# Altium schematic sheet 3G Modem_Section.SchDoc
size A4; DocumentNumber: 5; SheetNumber: 5; SheetTotal: 7
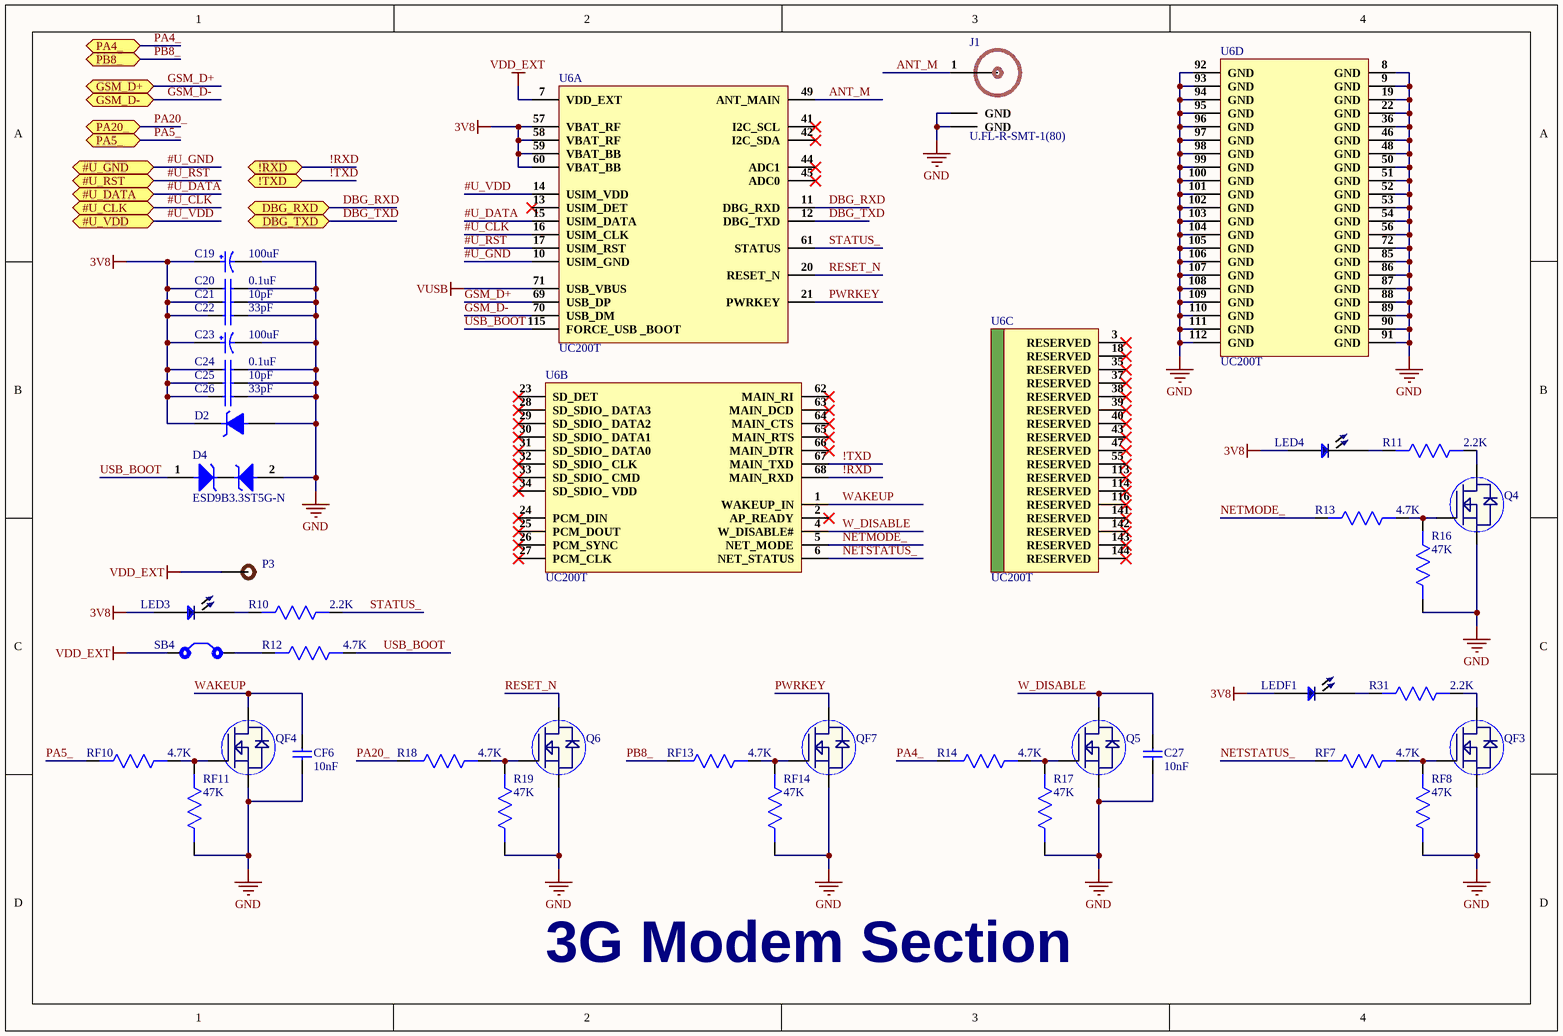
[diagram p0: 3G Modem_Section.SchDoc]

## Parts
C19  100uF  [16TQC100MYF]
C20  0.1uF  [Cap0402]
C21  10pF  [Cap0402]
C22  33pF  [Cap0402]
C23  100uF  [16TQC100MYF]
C24  0.1uF  [Cap0402]
C25  10pF  [Cap0402]
C26  33pF  [Cap0402]
C27  10nF  [Cap0402]
CF6  10nF  [Cap0402]
D2  BZD27C5V1P_R1_00001  [BZD27C5V1P_R1_00001]  (value not drawn)
D4  ESD9B3.3ST5G-N  [ESD9B3.3ST5G-N]
J1  U.FL-R-SMT-1(80)  [U.FL-R-SMT-1(80)]
LED3  TJ-S1005SW4TGLC6B-A5  [LED 0402]  (value not drawn)
LED4  TJ-S1005SW4TGLC7K-A5  [LED 0402]  (value not drawn)
LEDF1  TJ-S1005SW4TGLC7K-A5  [LED 0402]  (value not drawn)
P3  Test Point  [TEST POINT]  (value not drawn)
Q4  BSS138LT1G  [SOT23-3]  (value not drawn)
Q5  BSS138LT1G  [SOT23-3]  (value not drawn)
Q6  BSS138LT1G  [SOT23-3]  (value not drawn)
QF3  BSS138LT1G  [SOT23-3]  (value not drawn)
QF4  BSS138LT1G  [SOT23-3]  (value not drawn)
QF7  BSS138LT1G  [SOT23-3]  (value not drawn)
R10  2.2K  [Res0402]
R11  2.2K  [Res0402]
R12  4.7K  [Res0402]
R13  4.7K  [Res0402]
R14  4.7K  [Res0402]
R16  47K  [Res0402]
R17  47K  [Res0402]
R18  4.7K  [Res0402]
R19  47K  [Res0402]
R31  2.2K  [Res0402]
RF7  4.7K  [Res0402]
RF8  47K  [Res0402]
RF10  4.7K  [Res0402]
RF11  47K  [Res0402]
RF13  4.7K  [Res0402]
RF14  47K  [Res0402]
SB4  Solder Bridge  [Solder Bridge]  (value not drawn)
U6  UC200T  [UC200T]  (parts A,B,C,D of 4)

## Ports
!RXD (bidir), !TXD (bidir), #U_CLK (bidir), #U_DATA (bidir), #U_GND (bidir), #U_RST (bidir), #U_VDD (bidir), DBG_RXD (bidir), DBG_TXD (bidir), GSM_D+ (bidir), GSM_D- (bidir), PA4_ (bidir), PA5_ (bidir), PA20_ (bidir), PB8_ (bidir)

## Nets
3V8: C19.1 C20.1 C21.1 C22.1 C23.1 C24.1 C25.1 C26.1 D2.2(CATHODE) LED3.1 LED4.1 LEDF1.1 U6.57(VBAT_RF) U6.58(VBAT_RF) U6.59(VBAT_BB) U6.60(VBAT_BB)
GND: C19.2 C20.2 C21.2 C22.2 C23.2 C24.2 C25.2 C26.2 C27.1 CF6.1 D2.1(ANODE) D4.2 J1.2(GND) J1.3(GND) Q4.2(S) Q5.2(S) Q6.2(S) QF3.2(S) QF4.2(S) QF7.2(S) R16.2 R17.2 R19.2 RF8.2 RF11.2 RF14.2 U6.8(GND) U6.9(GND) U6.19(GND) U6.22(GND) U6.36(GND) U6.46(GND) U6.48(GND) U6.50(GND) U6.51(GND) U6.52(GND) U6.53(GND) U6.54(GND) U6.56(GND) U6.72(GND) U6.85(GND) U6.86(GND) U6.87(GND) U6.88(GND) U6.89(GND) U6.90(GND) U6.91(GND) U6.92(GND) U6.93(GND) U6.94(GND) U6.95(GND) U6.96(GND) U6.97(GND) U6.98(GND) U6.99(GND) U6.100(GND) U6.101(GND) U6.102(GND) U6.103(GND) U6.104(GND) U6.105(GND) U6.106(GND) U6.107(GND) U6.108(GND) U6.109(GND) U6.110(GND) U6.111(GND) U6.112(GND)
VDD_EXT: P3.1 SB4.1 U6.7(VDD_EXT)
VUSB: U6.71(USB_VBUS)
!RXD: U6.68(MAIN_RXD) ; port !RXD
!TXD: U6.67(MAIN_TXD) ; port !TXD
#U_CLK: U6.16(USIM_CLK) ; port #U_CLK
#U_DATA: U6.15(USIM_DATA) ; port #U_DATA
#U_GND: U6.10(USIM_GND) ; port #U_GND
#U_RST: U6.17(USIM_RST) ; port #U_RST
#U_VDD: U6.14(USIM_VDD) ; port #U_VDD
ANT_M: J1.1(RF_IN) U6.49(ANT_MAIN)
DBG_RXD: U6.11(DBG_RXD) ; port DBG_RXD
DBG_TXD: U6.12(DBG_TXD) ; port DBG_TXD
GSM_D+: U6.69(USB_DP) ; port GSM_D+
GSM_D-: U6.70(USB_DM) ; port GSM_D-
NETMODE_: R13.2 U6.5(NET_MODE)
NETSTATUS_: RF7.2 U6.6(NET_STATUS)
PA4_: R14.2 ; port PA4_
PA5_: RF10.2 ; port PA5_
PA20_: R18.2 ; port PA20_
PB8_: RF13.2 ; port PB8_
PWRKEY: QF7.3(D) U6.21(PWRKEY)
RESET_N: Q6.3(D) U6.20(RESET_N)
STATUS_: R10.1 U6.61(STATUS)
USB_BOOT: D4.1 R12.1 U6.115(FORCE_USB__BOOT)
W_DISABLE: C27.2 Q5.3(D) U6.4(W_DISABLE#)
WAKEUP: CF6.2 QF4.3(D) U6.1(WAKEUP_IN)
NetLED3_2: LED3.2 R10.2
NetLED4_2: LED4.2 R11.2
NetLEDF1_2: LEDF1.2 R31.2
NetQ4_1: Q4.1(G) R13.1 R16.1
NetQ4_3: Q4.3(D) R11.1
NetQ5_1: Q5.1(G) R14.1 R17.1
NetQ6_1: Q6.1(G) R18.1 R19.1
NetQF3_1: QF3.1(G) RF7.1 RF8.1
NetQF3_3: QF3.3(D) R31.1
NetQF4_1: QF4.1(G) RF10.1 RF11.1
NetQF7_1: QF7.1(G) RF13.1 RF14.1
NetR12_2: R12.2 SB4.2

Not connected (* = marked no-connect by the designer): U6 2(AP_READY)* 3(RESERVED)* 13(USIM_DET)* 18(RESERVED)* 23(SD_DET)* 24(PCM_DIN)* 25(PCM_DOUT)* 26(PCM_SYNC)* 27(PCM_CLK)* 28(SD_SDIO__DATA3)* 29(SD_SDIO__DATA2)* 30(SD_SDIO__DATA1)* 31(SD_SDIO__DATA0)* 32(SD_SDIO__CLK)* 33(SD_SDIO__CMD)* 34(SD_SDIO__VDD)* 35(RESERVED)* 37(RESERVED)* 38(RESERVED)* 39(RESERVED)* 40(RESERVED)* 41(I2C_SCL)* 42(I2C_SDA)* 43(RESERVED)* 44(ADC1)* 45(ADC0)* 47(RESERVED)* 55(RESERVED)* 62(MAIN_RI)* 63(MAIN_DCD)* 64(MAIN_CTS)* 65(MAIN_RTS)* 66(MAIN_DTR)* 113(RESERVED)* 114(RESERVED)* 116(RESERVED)* 141(RESERVED)* 142(RESERVED)* 143(RESERVED)* 144(RESERVED)*

## Notes on the sheet
- 3G Modem Section

## Library data of the parts
C19 C23 = 16TQC100MYF: CAP TANT POLY 100UF 16V 2917; Manufacturer: Panasonic; Material: Polymer; Tolerance: 20%; ESR (Equivalent Series Resistance): 50mR; Ripple Current: 1.8A; Leakage Current: 160uA; Polarity: Polar; Life (Hours): 2000Hour; Dissipation Factor: 10%; Supplier 1: Digi-Key; Manufacturer Part Number: 16TQC100MYF; Stock 1: 103103; Pricing 1: 1=3.55, 10=2.859, 100=2.2299, 500=1.65816, 1000=1.54381 (USD); Mount: Surface Mount; Case/Package: 2917; Number of Pins: 2; Case Code (Metric): 7343; Case Code (Imperial): 2917; Min Operating Temperature: -55°C; Max Operating Temperature: 105°C; Capacitance: 100uF; Packaging: Tape and Reel; Package Quantity: 3000; Voltage Rating: 16V; Voltage Rating (DC): 16V; Termination: SMD/SMT; Voltage: 16V; Features: General Purpose; Length: 7.3mm; Height: 1.9mm; Depth: 4.3mm; Width: 4.3mm; Height - Seated (Max): 0.079inch; Radiation Hardening: No; REACH SVHC: No SVHC; Lead Free: Lead Free; ComponentLink1URL: http://industrial.panasonic.com/www-data/pdf/AAA8000/AAA8000CE14.pdf?src-supplier=Avnet; ComponentLink1Description: http://industrial.panasonic.com/www-data/pdf/AAA8000/AAA8000CE14.pdf?src-supplier=Avnet; ComponentLink2URL: http://www.farnell.com/datasheets/2059641.pdf?src-supplier=Farnell; ComponentLink2Description: http://www.farnell.com/datasheets/2059641.pdf?src-supplier=Farnell; ComponentLink3URL: http://www.farnell.com/datasheets/1734368.pdf?src-supplier=Element14; ComponentLink3Description: http://www.farnell.com/datasheets/1734368.pdf?src-supplier=Element14; Supplier Part Number 1: P16237CT-ND
C20 C24 = CC0402KRX7R7BB104: CAP CER 0.1UF 16V X7R 0402; Manufacturer: Yageo; Tolerance: 10%; Capacitance: 100nF; Supplier 1: Digi-Key; Manufacturer Part Number: CC0402KRX7R7BB104; Stock 1: 16982736; Pricing 1: 1=0.1, 10=0.034, 100=0.015, 500=0.0107, 1000=0.00841, 2500=0.00764, 5000=0.00703 (USD); Mount: Surface Mount; Case/Package: 0402; Number of Pins: 2; Case Code (Metric): 1005; Case Code (Imperial): 0402; Min Operating Temperature: -55°C; Max Operating Temperature: 125°C; Dielectric: X7R; Voltage Rating: 16V; Voltage Rating (DC): 16V; Packaging: Tape and Reel; Package Quantity: 1; Termination: SMD/SMT; Composition: Ceramic; Voltage: 16V; Length: 1mm; Height: 0.5mm; Width: 0.02inch; Thickness: 0.022inch; Depth: 0.5mm; Radiation Hardening: No; REACH SVHC: No SVHC; Lead Free: Lead Free; Halogen Free: Halogen Free; ComponentLink1URL: http://www.yageo.com/documents/recent/UPY-GPHC_X7R_6.3V-to-50V_8.pdf?src-supplier=Avnet+Europe; ComponentLink1Description: http://www.yageo.com/documents/recent/UPY-GPHC_X7R_6.3V-to-50V_8.pdf?src-supplier=Avnet+Europe; ComponentLink2URL: http://www.yageo.com/documents/recent/UPY-GPHC_X7R_6.3V-to-50V_18.pdf?src-supplier=Digi-Key; ComponentLink2Description: http://www.yageo.com/documents/recent/UPY-GPHC_X7R_6.3V-to-50V_18.pdf?src-supplier=Digi-Key; ComponentLink3URL: http://www.yageo.com/documents/recent/UPY-GPHC_X7R_6.3V-to-50V_8.pdf?src-supplier=Avnet; ComponentLink3Description: http://www.yageo.com/documents/recent/UPY-GPHC_X7R_6.3V-to-50V_8.pdf?src-supplier=Avnet; ComponentLink4URL: http://www.yageo.com/documents/recent/UPY-GPHC_X7R_6.3V-to-50V_18.pdf?src-supplier=Mouser; ComponentLink4Description: http://www.yageo.com/documents/recent/UPY-GPHC_X7R_6.3V-to-50V_18.pdf?src-supplier=Mouser; ComponentLink5URL: http://www.farnell.com/datasheets/2167236.pdf?src-supplier=Element14; ComponentLink5Description: http://www.farnell.com/datasheets/2167236.pdf?src-supplier=Element14; ComponentLink6URL: http://www.farnell.com/datasheets/1489800.pdf?src-supplier=Element14; ComponentLink6Description: http://www.farnell.com/datasheets/1489800.pdf?src-supplier=Element14; Supplier Part Number 1: 311-1338-1-ND
C21 C25 = 0402N100J250CT: 10pF ±5% 25V NP0(C0G) 0402 Multilayer Ceramic Capacitors MLCC - SMD/SMT RoHS; Manufacturer: Walsin Tech Corp; Manufacturer Part No: 0402N100J250CT; Package: 0402; Value: 10pF
C22 C26 = 0402N330K250CT: 33pF ±10% 25V NP0(C0G) 0402 Multilayer Ceramic Capacitors MLCC - SMD/SMT RoHS; Manufacturer: Walsin Tech Corp; Manufacturer Part No: 0402N330K250CT; Package: 0402; Value: 33pF
C27 CF6 = CC0402KRX7R8BB103: CAP CER 10000PF 25V X7R 0402; Manufacturer: Yageo; Tolerance: 10%; Supplier 1: Digi-Key; Manufacturer Part Number: CC0402KRX7R8BB103; Stock 1: 0; Pricing 1: 1=0.1, 10=0.021, 100=0.0093, 500=0.00666, 1000=0.00523, 2500=0.00476, 5000=0.00438 (USD); Mount: Surface Mount; Case/Package: 0402; Case Code (Metric): 1005; Case Code (Imperial): 0402; Min Operating Temperature: -55°C; Max Operating Temperature: 125°C; Capacitance: 10nF; Dielectric: X7R; Voltage Rating: 25V; Package Quantity: 1; Packaging: Tape and Reel; Voltage Rating (DC): 25V; Termination: SMD/SMT; Composition: Ceramic; Length: 1mm; Height: 0.5mm; Depth: 0.5mm; Width: 0.02inch; Thickness: 0.022inch; Radiation Hardening: No; REACH SVHC: Unknown; Lead Free: Lead Free; Halogen Free: Halogen Free; ComponentLink1URL: http://www.yageo.com/documents/recent/UPY-GPHC_X7R_6.3V-to-50V_18.pdf?src-supplier=Digi-Key; ComponentLink1Description: http://www.yageo.com/documents/recent/UPY-GPHC_X7R_6.3V-to-50V_18.pdf?src-supplier=Digi-Key; ComponentLink2URL: https://www.verical.com/server-webapp/html/getDatasheet?partID=375418&src-supplier=Verical; ComponentLink2Description: https://www.verical.com/server-webapp/html/getDatasheet?partID=375418&src-supplier=Verical; ComponentLink3URL: http://www.yageo.com/documents/recent/UPY-GPHC_X7R_6.3V-to-50V_8.pdf?src-supplier=Avnet; ComponentLink3Description: http://www.yageo.com/documents/recent/UPY-GPHC_X7R_6.3V-to-50V_8.pdf?src-supplier=Avnet; ComponentLink4URL: https://4donline.ihs.com/images/VipMasterIC/IC/YAGO/YAGO-S-A0003557223/YAGO-S-A0003557223-1.pdf?hkey=52A5661711E402568146F3353EA87419&src-supplier=Element14; ComponentLink4Description: https://4donline.ihs.com/images/VipMasterIC/IC/YAGO/YAGO-S-A0003557223/YAGO-S-A0003557223-1.pdf?hkey=52A5661711E402568146F3353EA87419&src-supplier=Element14; ComponentLink5URL: http://www.farnell.com/datasheets/2167236.pdf?src-supplier=Element14; ComponentLink5Description: http://www.farnell.com/datasheets/2167236.pdf?src-supplier=Element14; ComponentLink6URL: http://www.mouser.com/ds/2/447/Yageo_UPY-GP_NP0_16V-to-50V_9-358835.pdf?src-supplier=Mouser; ComponentLink6Description: http://www.mouser.com/ds/2/447/Yageo_UPY-GP_NP0_16V-to-50V_9-358835.pdf?src-supplier=Mouser; Supplier Part Number 1: 311-1337-1-ND
D2 = BZD27C5V1P_R1_00001: 5.1V 800mW 5uA @ 1V SOD-123FL Zener Diodes RoHS; Manufacturer: PANJIT International; Value: Custom; Manufacturer Part No: BZD27C5V1P_R1_00001; Package: SOD-123FL
D4 = ESD9B3.3ST5G-N: Bidirectional 3.3V (Max) 3.8V 8V 10A (8/20us) SMD TVS RoHS; Manufacturer: Bourne Semicon (Shenzhen); ComponentLink1URL: https://www.mouser.com/ds/2/302/PESD3V3X1BL-64229.pdf?src-supplier=Mouser; ComponentLink1Description: https://www.mouser.com/ds/2/302/PESD3V3X1BL-64229.pdf?src-supplier=Mouser; ComponentLink2URL: https://assets.nexperia.com/documents/data-sheet/PESD3V3X1BL.pdf?src-supplier=Digi-Key; ComponentLink2Description: https://assets.nexperia.com/documents/data-sheet/PESD3V3X1BL.pdf?src-supplier=Digi-Key; ComponentLink3URL: http://www.onsemi.cn/pub_link/Collateral/ESD9B-D.PDF?src-supplier=Digi-Key; ComponentLink3Description: http://www.onsemi.cn/pub_link/Collateral/ESD9B-D.PDF?src-supplier=Digi-Key; ComponentLink4URL: http://www.onsemi.com/pub/Collateral/ESD9B-D.PDF?src-supplier=Avnet+Europe; ComponentLink4Description: http://www.onsemi.com/pub/Collateral/ESD9B-D.PDF?src-supplier=Avnet+Europe; ComponentLink5URL: http://www.mouser.com/ds/2/308/ESD9B-D-479788.pdf?src-supplier=Mouser; ComponentLink5Description: http://www.mouser.com/ds/2/308/ESD9B-D-479788.pdf?src-supplier=Mouser; ComponentLink6URL: http://www.farnell.com/datasheets/1596367.pdf?src-supplier=Element14; ComponentLink6Description: http://www.farnell.com/datasheets/1596367.pdf?src-supplier=Element14; ComponentLink7URL: https://www.verical.com/server-webapp/html/getDatasheet?partID=292713&src-supplier=Verical; ComponentLink7Description: https://www.verical.com/server-webapp/html/getDatasheet?partID=292713&src-supplier=Verical; ComponentLink8URL: http://www.onsemi.com/pub/Collateral/ESD9B-D.PDF?src-supplier=Avnet; ComponentLink8Description: http://www.onsemi.com/pub/Collateral/ESD9B-D.PDF?src-supplier=Avnet; Manufacturer Part No: ESD9B3.3ST5G-N; Package: DFN1006; Value: 3.3V
J1 = U.FL-R-SMT-1(80): CONN U.FL RCPT STR 50 OHM SMD; Manufacturer: Hirose; Supplier 1: Future Electronics; Manufacturer Part Number: U.FL-R-SMT-1(80); Stock 1: 1272; Pricing 1: 1=1.07, 500=0.785, 1500=0.74, 2500=0.72, 5000=0.695 (USD); Case/Package: SMD/SMT; Package Quantity: 10000; Packaging: Tape and Reel; Lead Free: Lead Free; ComponentLink1URL: https://www.hirose.com/product/en/download_file/key_name/U.FL-R-SMT-1%2880%29/category/Specification%20Sheet/doc_file_id/37638/?file_category_id=9&item_id=03310472280&is_series=&src-supplier=Digi-Key; ComponentLink1Description: https://www.hirose.com/product/en/download_file/key_name/U.FL-R-SMT-1%2880%29/category/Specification%20Sheet/doc_file_id/37638/?file_category_id=9&item_id=03310472280&is_series=&src-supplier=Digi-Key; ComponentLink2URL: http://www.mouser.com/ds/2/185/U.FL_catalog-939761.pdf?src-supplier=Mouser; ComponentLink2Description: http://www.mouser.com/ds/2/185/U.FL_catalog-939761.pdf?src-supplier=Mouser; Supplier Part Number 1: U.FL-R-SMT-1(80)-CUTT
LED3 = TJ-S1005SW4TGLC6B-A5: Blue 465nm 0402 Light Emitting Diodes (LED) RoHS; Manufacturer: TOGIALED; Value: Custom; Manufacturer Part No: TJ-S1005SW4TGLC6B-A5; Package: 0402
LED4 LEDF1 = TJ-S1005SW4TGLC7K-A5: Green 573nm 0402 Light Emitting Diodes (LED) RoHS; Manufacturer: TOGIALED; Value: Custom; Manufacturer Part No: TJ-S1005SW4TGLC7K-A5; Package: 0402
P3 = TEST POINT: Test Point ON
Q4-Q6 QF3 QF4 QF7 = BSS138LT1G: MOSFET N-CH 50V 200MA SOT-23; Manufacturer: ON Semiconductor; Gate to Source Voltage (Vgs): 20V; Nominal Vgs: 1.5V; Rds On Max: 3.5R; Input Capacitance: 50pF; Number of Elements: 1; Max Power Dissipation: 225mW; Turn-Off Delay Time: 20ns; Element Configuration: Single; ComponentLink1URL: https://datasheet.ciiva.com/22641/1596366-22641636.pdf; ComponentLink1Description: https://datasheet.ciiva.com/22641/1596366-22641636.pdf; ComponentLink2URL: https://datasheet.ciiva.com/1190/1596366-1190137.pdf; ComponentLink2Description: https://datasheet.ciiva.com/1190/1596366-1190137.pdf; ComponentLink3URL: https://datasheet.ciiva.com/15198/getdatasheetpartid-110266-15198908.pdf; ComponentLink3Description: https://datasheet.ciiva.com/15198/getdatasheetpartid-110266-15198908.pdf; ComponentLink4URL: https://datasheet.ciiva.com/8115/bss138lt1-d-8115295.pdf; ComponentLink4Description: https://datasheet.ciiva.com/8115/bss138lt1-d-8115295.pdf; ComponentLink5URL: https://datasheet.ciiva.com/8115/bss138lt1-d-8115358.pdf; ComponentLink5Description: https://datasheet.ciiva.com/8115/bss138lt1-d-8115358.pdf; ComponentLink6URL: https://datasheet.ciiva.com/1190/1596366-1190136.pdf; ComponentLink6Description: https://datasheet.ciiva.com/1190/1596366-1190136.pdf; ComponentLink7URL: https://datasheet.ciiva.com/936/bss138lt1-d-936802.pdf; ComponentLink7Description: https://datasheet.ciiva.com/936/bss138lt1-d-936802.pdf; ComponentLink8URL: https://datasheet.ciiva.com/936/bss138lt1-d-936801.pdf; ComponentLink8Description: https://datasheet.ciiva.com/936/bss138lt1-d-936801.pdf; ComponentLink9URL: https://datasheet.ciiva.com/14553/70099493-14553829.pdf; ComponentLink9Description: https://datasheet.ciiva.com/14553/70099493-14553829.pdf; ComponentLink10URL: https://datasheet.ciiva.com/936/bss138lt1-d-936803.pdf; ComponentLink10Description: https://datasheet.ciiva.com/936/bss138lt1-d-936803.pdf; Supplier 1: Digi-Key; Manufacturer Part Number: BSS138LT1G; Stock 1: 1283212; Pricing 1: 1=0.27, 10=0.222, 100=0.1177, 500=0.07746, 1000=0.05267 (USD); Case/Package: SOT-23-3; Number of Pins: 3; Contact Plating: Tin,Matte; Min Operating Temperature: -55°C; Max Operating Temperature: 150°C; Continuous Drain Current (ID): 200mA; Package Quantity: 1; Packaging: Tape and Reel; Drain to Source Breakdown Voltage: 50V; Power Dissipation: 225mW; Drain to Source Resistance: 3.5R; Threshold Voltage: 1.5V; Turn-On Delay Time: 20ns; Voltage Rating (DC): 50V; Current Rating: 200mA; On-State Resistance: 3.5R; Length: 3.04mm; Height: 1.01mm; Width: 1.4mm; Radiation Hardening: No; REACH SVHC: No SVHC; Lead Free: Lead Free; Halogen Free: Halogen Free; ComponentLink11URL: http://www.onsemi.com/pub/Collateral/BSS138LT1-D.PDF?src-supplier=Digi-Key; ComponentLink11Description: http://www.onsemi.com/pub/Collateral/BSS138LT1-D.PDF?src-supplier=Digi-Key; ComponentLink12URL: http://www.farnell.com/datasheets/1596366.pdf?src-supplier=Element14; ComponentLink12Description: http://www.farnell.com/datasheets/1596366.pdf?src-supplier=Element14; ComponentLink13URL: http://www.alliedelec.com/m/d/b3c6fd7d92596813fe75d33dcbaaae90.pdf?src-supplier=Allied+Electronics; ComponentLink13Description: http://www.alliedelec.com/m/d/b3c6fd7d92596813fe75d33dcbaaae90.pdf?src-supplier=Allied+Electronics; ComponentLink14URL: https://www.verical.com/server-webapp/html/getDatasheet?partID=110266&src-supplier=Verical; ComponentLink14Description: https://www.verical.com/server-webapp/html/getDatasheet?partID=110266&src-supplier=Verical; ComponentLink15URL: http://www.onsemi.com/pub_link/Collateral/BSS138LT1-D.PDF?src-supplier=Avnet; ComponentLink15Description: http://www.onsemi.com/pub_link/Collateral/BSS138LT1-D.PDF?src-supplier=Avnet; Supplier Part Number 1: BSS138LT1GOSDKR-ND
R10 R11 R31 = RC0402FR-072K2L: RES SMD 2.2K OHM 1% 1/16W 0402; Manufacturer: Yageo; Resistance: 2.2kR; Power Rating: 63mW; Voltage Rating: 50V; Temperature Coefficient: 100ppm/°C; Supplier 1: Digi-Key; Manufacturer Part Number: RC0402FR-072K2L; Stock 1: 0; Pricing 1: 1=0.1, 10=0.016, 100=0.0064, 1000=0.00289, 2500=0.00251, 5000=0.00207 (USD); Case/Package: 0402; Weight: 2.3E-05oz; Case Code (Imperial): 0402; Case Code (Metric): 1005; Min Operating Temperature: -55°C; Max Operating Temperature: 155°C; Composition: Thick Film; Packaging: Tape and Reel; Tolerance: 1%; Termination: SMD/SMT; Military Standard: Not; Length: 1mm; Height: 0.35mm; Width: 0.5mm; Depth: 0.5mm; REACH SVHC: Unknown; Lead Free: Lead Free; ComponentLink1URL: http://documents.rs-components.com/techlib://itc_doclist_GB.htm?stockno=6186532&src-supplier=RSComponents; ComponentLink1Description: http://documents.rs-components.com/techlib://itc_doclist_GB.htm?stockno=6186532&src-supplier=RSComponents; ComponentLink2URL: http://www.yageo.com/documents/recent/PYu-RC_Group_51_RoHS_L_9.pdf?src-supplier=Mouser; ComponentLink2Description: http://www.yageo.com/documents/recent/PYu-RC_Group_51_RoHS_L_9.pdf?src-supplier=Mouser; ComponentLink3URL: http://www.yageo.com/documents/recent/PYu-RC0402_51_RoHS_L_6_r.pdf?src-supplier=Future+Electronics; ComponentLink3Description: http://www.yageo.com/documents/recent/PYu-RC0402_51_RoHS_L_6_r.pdf?src-supplier=Future+Electronics; ComponentLink4URL: http://www.farnell.com/datasheets/2167052.pdf?src-supplier=Element14; ComponentLink4Description: http://www.farnell.com/datasheets/2167052.pdf?src-supplier=Element14; Supplier Part Number 1: 311-2.20KLRDKR-ND
R12-R14 R18 RF7 RF10 RF13 = CR0402JF0472G: 4.7K ±5% 1/16W ±200ppm/°C 0402 Chip Resistor - Surface Mount RoHS; Manufacturer: LIZ Elec; Manufacturer Part No: CR0402JF0472G; Package: 0402; Value: 4.7K
R16 R17 R19 RF8 RF11 RF14 = RC0402FR-0747KL: RES SMD 47K OHM 1% 1/16W 0402; Manufacturer: Yageo; Power Rating: 62.5mW; Temperature Coefficient: 100ppm/°C; Voltage Rating: 50V; Resistance: 47kR; Max Power Dissipation: 63mW; Supplier 1: Digi-Key; Manufacturer Part Number: RC0402FR-0747KL; Stock 1: 0; Pricing 1: 1=0.1, 10=0.016, 100=0.0064, 1000=0.00289, 2500=0.00251, 5000=0.00207 (USD); Case/Package: 0402; Case Code (Imperial): 0402; Case Code (Metric): 1005; Min Operating Temperature: -55°C; Max Operating Temperature: 155°C; Tolerance: 1%; Packaging: Tape and Reel; Package Quantity: 1; Termination: SMD/SMT; Composition: Thick Film; Number of Terminations: 2; Military Standard: Not; Features: Moisture Resistant; Length: 1mm; Height: 0.016inch; Depth: 0.5mm; Width: 0.5mm; REACH SVHC: Unknown; Lead Free: Lead Free; ComponentLink1URL: http://www.yageo.com/documents/recent/PYu-RC0402_51_RoHS_L_6_r.pdf?src-supplier=Future+Electronics; ComponentLink1Description: http://www.yageo.com/documents/recent/PYu-RC0402_51_RoHS_L_6_r.pdf?src-supplier=Future+Electronics; ComponentLink2URL: http://www.farnell.com/datasheets/1018594.pdf?src-supplier=Element14; ComponentLink2Description: http://www.farnell.com/datasheets/1018594.pdf?src-supplier=Element14; ComponentLink3URL: https://www.verical.com/server-webapp/html/getDatasheet?partID=323748&src-supplier=Verical; ComponentLink3Description: https://www.verical.com/server-webapp/html/getDatasheet?partID=323748&src-supplier=Verical; ComponentLink4URL: http://www.yageo.com/documents/recent/PYu-RC_Group_51_RoHS_L_10.pdf?src-supplier=Digi-Key; ComponentLink4Description: http://www.yageo.com/documents/recent/PYu-RC_Group_51_RoHS_L_10.pdf?src-supplier=Digi-Key; Supplier Part Number 1: 311-47.0KLRDKR-ND
SB4 = Solder Bridge: Solder Bridge ON
U6 = UC200T: UMTS/HSPA+ Module; Manufacturer: Quectel; Value: Custom; Manufacturer Part No: UC200T; Package: Custom